# Altium project Control_Board.PrjPcb (part 1 of 2)
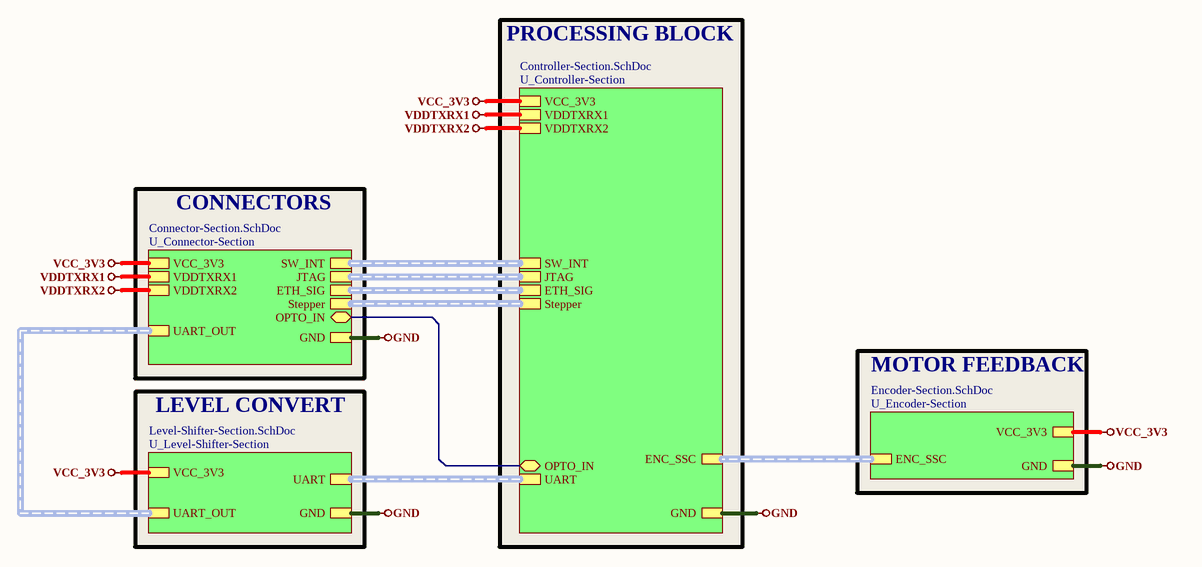
[diagram p0: Top-Sheet.SchDoc]
7 sheets, 87 parts. Net scope: hierarchical (ports join the sheet entries above them; power ports are global).
Board file: ControlBoard_PCB.PcbDoc
Sheets:
  Top-Sheet.SchDoc
    U_Connector-Section = Connector-Section.SchDoc
    U_Level-Shifter-Section = Level-Shifter-Section.SchDoc
    U_Controller-Section = Controller-Section.SchDoc
      U_Controller-Part-1 = Controller-Part-1.SchDoc
      U_Controller-Part-2 = Controller-Part-2.SchDoc
    U_Encoder-Section = Encoder-Section.SchDoc

## Sheet Top-Sheet.SchDoc
size A4; SheetNumber: 1

### Sub-sheets
U_Connector-Section = Connector-Section.SchDoc: SW_INT (harness SW_INT), JTAG (harness JTAG), ETH_SIG (harness ETH_SIG), VCC_3V3, GND, VDDTXRX1, VDDTXRX2, Stepper (harness Stepper), OPTO_IN (bidir), UART_OUT (harness UART_OUT)
U_Controller-Section = Controller-Section.SchDoc: JTAG (harness JTAG), SW_INT (harness SW_INT), ETH_SIG (harness ETH_SIG), Stepper (harness Stepper), VCC_3V3, ENC_SSC (harness ENC_SSC), UART (harness UART), GND, OPTO_IN (bidir), VDDTXRX1, VDDTXRX2
U_Encoder-Section = Encoder-Section.SchDoc: VCC_3V3, GND, ENC_SSC (harness ENC_SSC)
U_Level-Shifter-Section = Level-Shifter-Section.SchDoc: UART (harness UART), VCC_3V3, GND, UART_OUT (harness UART_OUT)

### Nets
GND: sheet U_Connector-Section/GND, sheet U_Level-Shifter-Section/GND, sheet U_Controller-Section/GND, sheet U_Encoder-Section/GND
VCC_3V3: sheet U_Connector-Section/VCC_3V3, sheet U_Level-Shifter-Section/VCC_3V3, sheet U_Controller-Section/VCC_3V3, sheet U_Encoder-Section/VCC_3V3
VDDTXRX1: sheet U_Connector-Section/VDDTXRX1, sheet U_Controller-Section/VDDTXRX1
VDDTXRX2: sheet U_Connector-Section/VDDTXRX2, sheet U_Controller-Section/VDDTXRX2
OPTO_IN: sheet U_Connector-Section/OPTO_IN, sheet U_Controller-Section/OPTO_IN

### Buses and harness runs
harness sheet U_Connector-Section/ETH_SIG = sheet U_Controller-Section/ETH_SIG
harness sheet U_Connector-Section/JTAG = sheet U_Controller-Section/JTAG
harness sheet U_Connector-Section/Stepper = sheet U_Controller-Section/Stepper
harness sheet U_Connector-Section/SW_INT = sheet U_Controller-Section/SW_INT
harness sheet U_Connector-Section/UART_OUT = sheet U_Level-Shifter-Section/UART_OUT
harness sheet U_Controller-Section/ENC_SSC = sheet U_Encoder-Section/ENC_SSC
harness sheet U_Controller-Section/UART = sheet U_Level-Shifter-Section/UART

### Notes on the sheet
- PROCESSING BLOCK
- CONNECTORS
- MOTOR FEEDBACK
- LEVEL CONVERT

## Sheet Connector-Section.SchDoc
size A4; SheetNumber: 7
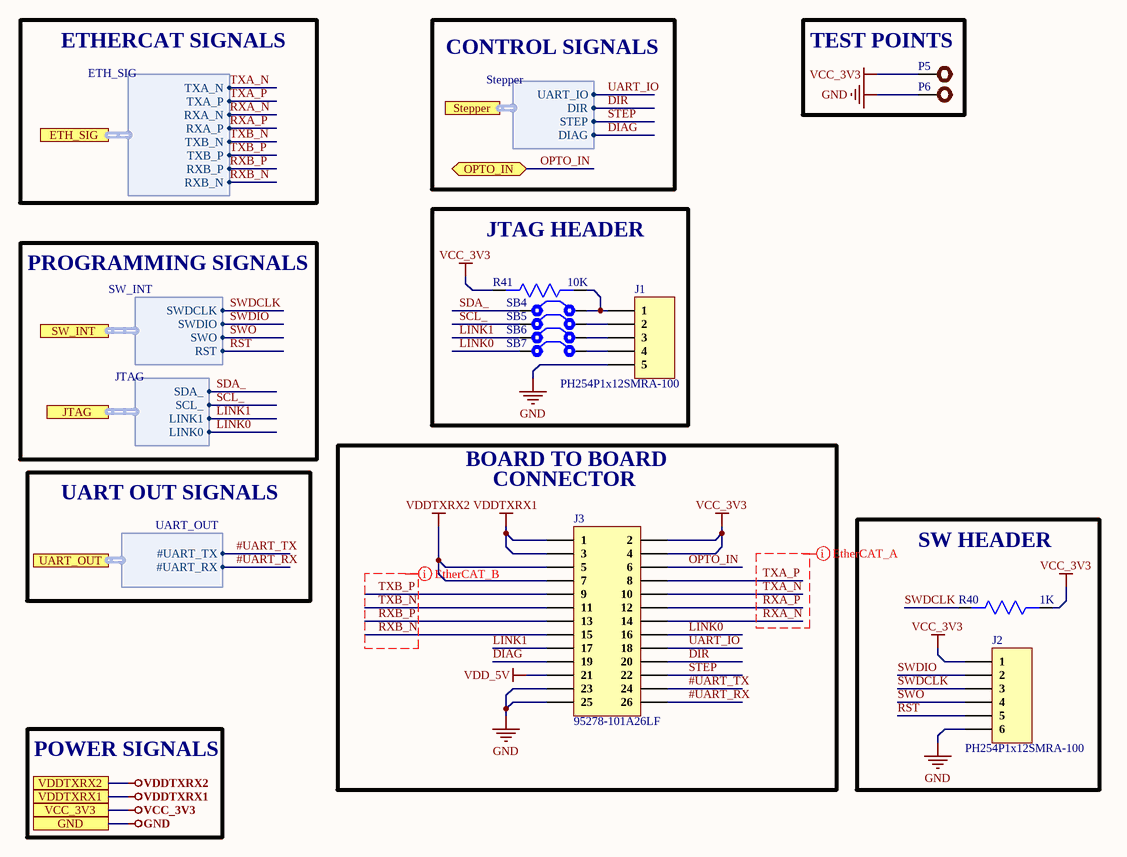
[diagram p1: Connector-Section.SchDoc]

### Parts
J1  PH254P1x12SMRA-100  [HDR1X5 SMD]
J2  PH254P1x12SMRA-100  [HDR1X6 SMD]
J3  95278-101A26LF  [95278-101A26LF]
P5  Test Point  [TEST POINT]  (value not drawn)
P6  Test Point  [TEST POINT]  (value not drawn)
R40  1K  [Res0603]
R41  10K  [Res0603]
SB4  Solder Bridge  [Solder Bridge]  (value not drawn)
SB5  Solder Bridge  [Solder Bridge]  (value not drawn)
SB6  Solder Bridge  [Solder Bridge]  (value not drawn)
SB7  Solder Bridge  [Solder Bridge]  (value not drawn)

### Blocks framed on the sheet
TEST POINTS: P5 P6
JTAG HEADER: J1 R41 SB4-SB7
SW HEADER: J2 R40

### Ports
ETH_SIG (harness ETH_SIG), GND, JTAG (harness JTAG), OPTO_IN (bidir), Stepper (harness Stepper), SW_INT (harness SW_INT), UART_OUT (harness UART_OUT), VCC_3V3, VDDTXRX1, VDDTXRX2

### Harnesses
SW_INT: SWDCLK, SWDIO, SWO, RST
JTAG: SDA_, SCL_, LINK1, LINK0
ETH_SIG: TXA_N, TXA_P, RXA_N, RXA_P, TXB_N, TXB_P, RXB_P, RXB_N
Stepper: UART_IO, DIR, STEP, DIAG
UART_OUT: #UART_TX, #UART_RX

### Nets
GND: J1.5 J2.6 J3.23 J3.25 P6.1 ; port GND
VCC_3V3: J2.1 J3.2 J3.4 P5.1 R40.1 R41.2 ; port VCC_3V3
VDD_5V: J3.21
VDDTXRX1: J3.1 J3.3 ; port VDDTXRX1
VDDTXRX2: J3.5 J3.7 ; port VDDTXRX2
#UART_RX: J3.26 ; port UART_OUT.#UART_RX
#UART_TX: J3.24 ; port UART_OUT.#UART_TX
DIAG: J3.19 ; port Stepper.DIAG
DIR: J3.20 ; port Stepper.DIR
LINK0: J3.16 SB7.1 ; port JTAG.LINK0
LINK1: J3.17 SB6.1 ; port JTAG.LINK1
OPTO_IN: J3.6 ; port OPTO_IN
RST: J2.5 ; port SW_INT.RST
RXA_N: J3.14 ; port ETH_SIG.RXA_N
RXA_P: J3.12 ; port ETH_SIG.RXA_P
RXB_N: J3.15 ; port ETH_SIG.RXB_N
RXB_P: J3.13 ; port ETH_SIG.RXB_P
SCL_: SB5.1 ; port JTAG.SCL_
SDA_: SB4.1 ; port JTAG.SDA_
STEP: J3.22 ; port Stepper.STEP
SWDCLK: J2.3 R40.2 ; port SW_INT.SWDCLK
SWDIO: J2.2 ; port SW_INT.SWDIO
SWO: J2.4 ; port SW_INT.SWO
TXA_N: J3.10 ; port ETH_SIG.TXA_N
TXA_P: J3.8 ; port ETH_SIG.TXA_P
TXB_N: J3.11 ; port ETH_SIG.TXB_N
TXB_P: J3.9 ; port ETH_SIG.TXB_P
UART_IO: J3.18 ; port Stepper.UART_IO
NetJ1_1: J1.1 R41.1 SB4.2
NetJ1_2: J1.2 SB5.2
NetJ1_3: J1.3 SB6.2
NetJ1_4: J1.4 SB7.2

### Layout directives
differential pair; differential pair class EtherCAT_A_Lines; net class EtherCAT_A; rule Matched Net Lengths [Tolerance = 1000mil]; rule Impedance Constraint [Min = 90.00    Max = 110.0    ]: RXA_N, RXA_P, TXA_N, TXA_P
differential pair; differential pair class EtherCAT_B_Lines; net class EtherCAT_B; rule Matched Net Lengths [Tolerance = 1000mil]; rule Impedance Constraint [Min = 90.00    Max = 110.0    ]: RXB_N, RXB_P, TXB_N, TXB_P

### Notes on the sheet
- ETHERCAT SIGNALS
- CONTROL SIGNALS
- PROGRAMMING SIGNALS
- BOARD TO BOARD
- UART OUT SIGNALS
- (near J3) CONNECTOR
- POWER SIGNALS

### Library data of the parts
J1 = PH254P1x12SMRA-100: 5 POS 2.54mm Pin Header Male single row Right Angle SMD; Manufacturer: RTLECS; Pin shape: Square pin; Pitch: 2.54
J2 = PH254P1x12SMRA-100_1: 6 POS 2.54mm Pin Header Male single row Right Angle SMD; Manufacturer: RTLECS; Pin shape: Square pin; Pitch: 2.54
J3 = 95278-101A26LF: CONN HEADER SMD 26POS 2.54MM; Manufacturer: Amphenol ICC (FCI); Manufacturer Part No:: 95278-101A26LF; Package: Custom; ComponentLink1Description: New link; ComponentLink1URL: https://www.digikey.com/en/products/detail/amphenol-icc-fci/95278-101A26LF/1488594
P5 P6 = TEST POINT: Test Point ON
R40 = RC0603FR-071KL: RES SMD 1K OHM 1% 1/10W 0603; Manufacturer: Yageo; Resistance: 1kR; Temperature Coefficient: 100ppm/°C; Power Rating: 100mW; Voltage Rating: 50V; ComponentLink1URL: https://www.verical.com/server-webapp/html/getDatasheet?partID=409289&src-supplier=Verical; ComponentLink1Description: https://www.verical.com/server-webapp/html/getDatasheet?partID=409289&src-supplier=Verical; Supplier 1: Digi-Key; Manufacturer Part Number: RC0603FR-071KL; Stock 1: 21472395; Pricing 1: 1=0.1, 10=0.023, 100=0.0094, 1000=0.0042, 2500=0.0037 (USD); Case/Package: 0603; Contact Plating: Tin,Matte; Case Code (Imperial): 0603; Case Code (Metric): 1608; Min Operating Temperature: -55°C; Max Operating Temperature: 155°C; Tolerance: 1%; Composition: Thick Film; Packaging: Tape and Reel; Termination: SMD/SMT; Military Standard: Not; Length: 1.6mm; Height: 0.45mm; Depth: 0.8mm; Radiation Hardening: No; REACH SVHC: No SVHC; Lead Free: Lead Free; ComponentLink2URL: http://documents.rs-components.com/techlib://itc_doclist_GB.htm?stockno=5048928&src-supplier=RSComponents; ComponentLink2Description: http://documents.rs-components.com/techlib://itc_doclist_GB.htm?stockno=5048928&src-supplier=RSComponents; ComponentLink3URL: http://www.yageo.com/documents/recent/PYu-RC0603_51_RoHS_L_4.pdf?src-supplier=Avnet+Europe; ComponentLink3Description: http://www.yageo.com/documents/recent/PYu-RC0603_51_RoHS_L_4.pdf?src-supplier=Avnet+Europe; ComponentLink4URL: http://www.farnell.com/datasheets/2167052.pdf?src-supplier=Element14; ComponentLink4Description: http://www.farnell.com/datasheets/2167052.pdf?src-supplier=Element14; ComponentLink5URL: http://www.farnell.com/datasheets/1868787.pdf?src-supplier=Element14; ComponentLink5Description: http://www.farnell.com/datasheets/1868787.pdf?src-supplier=Element14; ComponentLink6URL: http://www.yageo.com/documents/recent/PYu-RC_Group_51_RoHS_L_2.pdf?src-supplier=Avnet; ComponentLink6Description: http://www.yageo.com/documents/recent/PYu-RC_Group_51_RoHS_L_2.pdf?src-supplier=Avnet; ComponentLink7URL: https://www.verical.com/server-webapp/html/getDatasheet?partID=404327&src-supplier=Verical; ComponentLink7Description: https://www.verical.com/server-webapp/html/getDatasheet?partID=404327&src-supplier=Verical; ComponentLink8URL: http://www.farnell.com/datasheets/443971.pdf?src-supplier=Element14; ComponentLink8Description: http://www.farnell.com/datasheets/443971.pdf?src-supplier=Element14; Supplier Part Number 1: 311-1.00KHRDKR-ND
R41 = AC0603JR-0710KL: RES SMD 10K OHM 5% 1/10W 0603; Manufacturer: Yageo; Voltage Rating: 50V; Resistance: 10kR; Power Rating: 100mW; Temperature Coefficient: 100ppm/°C; Supplier 1: Future Electronics; Manufacturer Part Number: AC0603JR-0710KL; RoHS: Yes; Category: Chip SMD Resistors; Stock 1: 1533000; Pricing 1: 5000=0.00540 (USD); Case/Package: 0603; Case Code (Imperial): 0603; Case Code (Metric): 1608; Size Code: 0603; Min Operating Temperature: -55°C; Max Operating Temperature: 155°C; Packaging: Tape and Reel; Tolerance: 5%; Package Quantity: 1; Resistor Type: Thick Film; Termination: SMD/SMT; Number of Terminations: 2; Max Power Dissipation: 100mW; Features: Moisture Resistant,Automotive AEC-Q200,Anti-Sulfur; Series: AC; Construction: Rectangular; Length: 0.063inch; Width: 0.031inch; Height: 0.022inch; Depth: 0.8mm; Military Standard: Not; Lead Free: Lead Free; RoHS Compliant: Yes; ComponentLink1URL: https://datasheet.ciiva.com/5562/pyu-ac-51-rohs-l-2-5562553.pdf?src-supplier=Mouser; ComponentLink1Description: https://datasheet.ciiva.com/5562/pyu-ac-51-rohs-l-2-5562553.pdf?src-supplier=Mouser; Supplier Part Number 1: 1029044
SB4-SB7 = Solder Bridge: Solder Bridge ON

## Sheet Level-Shifter-Section.SchDoc
size A4; SheetNumber: 6
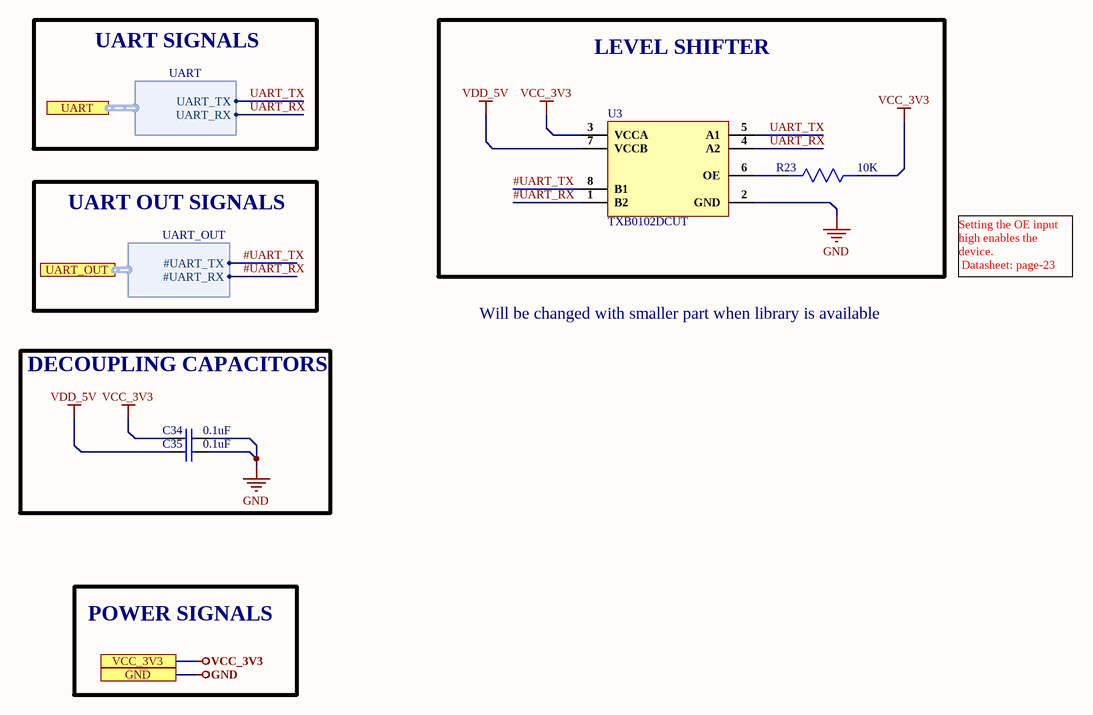
[diagram p2: Level-Shifter-Section.SchDoc]

### Parts
C34  0.1uF  [Cap0603]
C35  0.1uF  [Cap0603]
R23  10K  [Res0603]
U3  TXB0102DCUT  [TXB0102DCUT]

### Blocks framed on the sheet
LEVEL SHIFTER: R23 U3
DECOUPLING CAPACITORS: C34 C35

### Ports
GND, UART (harness UART), UART_OUT (harness UART_OUT), VCC_3V3

### Harnesses
UART: UART_TX, UART_RX
UART_OUT: #UART_TX, #UART_RX

### Nets
GND: C34.2 C35.2 U3.2(GND) ; port GND
VCC_3V3: C34.1 R23.1 U3.3(VCCA) ; port VCC_3V3
VDD_5V: C35.1 U3.7(VCCB)
#UART_RX: U3.1(B2) ; port UART_OUT.#UART_RX
#UART_TX: U3.8(B1) ; port UART_OUT.#UART_TX
UART_RX: U3.4(A2) ; port UART.UART_RX
UART_TX: U3.5(A1) ; port UART.UART_TX
NetR23_2: R23.2 U3.6(OE)

### Notes on the sheet
- UART SIGNALS
- UART OUT SIGNALS
- Will be changed with smaller part when library is available
- Setting the OE input high enables the device.
  Datasheet: page-23
- POWER SIGNALS

### Library data of the parts
C34 C35 = CC0603KRX7R0BB104: CAP CER 0.1UF 100V X7R 0603; Manufacturer: Yageo; Capacitance: 100nF; Tolerance: 10%; Supplier 1: Digi-Key; Manufacturer Part Number: CC0603KRX7R0BB104; RoHS: Yes; Category: Ceramic Capacitors; Stock 1: 60476; Pricing 1: 1=0.19000, 10=0.13500, 50=0.07680, 100=0.06370, 500=0.04466, 1000=0.03696 (USD); Mount: Surface Mount; Case/Package: 0603; Case Code (Metric): 1608; Case Code (Imperial): 0603; Weight: 7.1E-05oz; Min Operating Temperature: -55°C; Max Operating Temperature: 125°C; Package Quantity: 4000; Voltage Rating: 100V; Packaging: Tape and Reel; Dielectric: X7R; Termination: SMD/SMT; Resistor Type: Ceramic; Voltage Rating (DC): 100V; Series: CC; Length: 0.063inch; Width: 0.031inch; Thickness: 0.035inch; Depth: 0.8mm; Lead Free: Lead Free; RoHS Compliant: Yes; ComponentLink1URL: https://datasheet.ciiva.com/6277/mlccorderingcode-6277030.pdf?src-supplier=Digi-Key; ComponentLink1Description: https://datasheet.ciiva.com/6277/mlccorderingcode-6277030.pdf?src-supplier=Digi-Key; ComponentLink2URL: https://datasheet.ciiva.com/6277/mlccorderingcode-6277081.pdf?src-supplier=Digi-Key; ComponentLink2Description: https://datasheet.ciiva.com/6277/mlccorderingcode-6277081.pdf?src-supplier=Digi-Key; ComponentLink3URL: https://datasheet.ciiva.com/6277/mlccorderingcode-6277082.pdf?src-supplier=Digi-Key; ComponentLink3Description: https://datasheet.ciiva.com/6277/mlccorderingcode-6277082.pdf?src-supplier=Digi-Key; Supplier Part Number 1: 311-1523-1-ND
R23 = AC0603JR-0710KL: as R41 on sheet Connector-Section; Supplier 1: Future Electronics; Manufacturer Part Number: AC0603JR-0710KL; RoHS: Yes; Category: Chip SMD Resistors; Stock 1: 1533000; Pricing 1: 5000=0.00540 (USD); Case/Package: 0603; Case Code (Imperial): 0603; Case Code (Metric): 1608; Size Code: 0603; Min Operating Temperature: -55°C; Max Operating Temperature: 155°C; Packaging: Tape and Reel; Tolerance: 5%; Package Quantity: 1; Resistor Type: Thick Film; Termination: SMD/SMT; Number of Terminations: 2; Max Power Dissipation: 100mW; Features: Moisture Resistant,Automotive AEC-Q200,Anti-Sulfur; Series: AC; Construction: Rectangular; Length: 0.063inch; Width: 0.031inch; Height: 0.022inch; Depth: 0.8mm; Military Standard: Not; Lead Free: Lead Free; RoHS Compliant: Yes; ComponentLink1URL: https://datasheet.ciiva.com/5562/pyu-ac-51-rohs-l-2-5562553.pdf?src-supplier=Mouser; ComponentLink1Description: https://datasheet.ciiva.com/5562/pyu-ac-51-rohs-l-2-5562553.pdf?src-supplier=Mouser; Supplier Part Number 1: 1029044
U3 = TXB0102DCUT: IC TRNSLTR BIDIRECTIONAL US8; Manufacturer: Texas Instruments; Propagation Delay: 31ns; Min Supply Voltage: 1.65V; Max Supply Voltage: 5.5V; Data Rate: 100Mbps; Number of Channels: 2; Logic Function: Translator; Turn-On Delay Time: 7.4ns; High Level Output Current: -20uA; Low Level Output Current: 20uA; Output Type: 3-STATE; Output Current: 50mA; Supplier 1: Arrow Electronics; Manufacturer Part Number: TXB0102DCUT; RoHS: Yes; Category: Integrated Circuits (ICs); Stock 1: 10; Pricing 1: 1=0.79330, 10=0.66470, 25=0.65820, 250=0.37450, 500=0.36200, 1000=0.29770, 2500=0.28440 (USD); Mount: Surface Mount; Case/Package: VSSOP; Number of Pins: 8; Weight: 0.000339oz; Contact Plating: Gold; Min Operating Temperature: -40°C; Max Operating Temperature: 85°C; Packaging: Tape and Reel; Package Quantity: 1; Number of Bits: 2; Series: -; Number of Inputs: 2; Length: 2.3mm; Width: 2mm; Height: 0.85mm; Radiation Hardening: No; Lead Free: Lead Free; RoHS Compliant: Yes; REACH SVHC: No SVHC; ComponentLink1URL: https://datasheet.ciiva.com/4226/sces641b-4226901.pdf?src-supplier=Arrow+Electronics; ComponentLink1Description: https://datasheet.ciiva.com/4226/sces641b-4226901.pdf?src-supplier=Arrow+Electronics; ComponentLink2URL: https://datasheet.ciiva.com/15096/getdatasheetpartid-226009-15096242.pdf?src-supplier=Verical; ComponentLink2Description: https://datasheet.ciiva.com/15096/getdatasheetpartid-226009-15096242.pdf?src-supplier=Verical; ComponentLink3URL: https://datasheet.ciiva.com/14287/txb0102-14287498.pdf?src-supplier=Avnet; ComponentLink3Description: https://datasheet.ciiva.com/14287/txb0102-14287498.pdf?src-supplier=Avnet; ComponentLink4URL: https://datasheet.ciiva.com/14287/txb0102-14287370.pdf?src-supplier=Avnet; ComponentLink4Description: https://datasheet.ciiva.com/14287/txb0102-14287370.pdf?src-supplier=Avnet; ComponentLink5URL: https://datasheet.ciiva.com/6619/txb0102-6619255.pdf?src-supplier=Digi-Key; ComponentLink5Description: https://datasheet.ciiva.com/6619/txb0102-6619255.pdf?src-supplier=Digi-Key; ComponentLink6URL: https://datasheet.ciiva.com/6619/txb0102-6619256.pdf?src-supplier=Digi-Key; ComponentLink6Description: https://datasheet.ciiva.com/6619/txb0102-6619256.pdf?src-supplier=Digi-Key; ComponentLink7URL: https://datasheet.ciiva.com/6619/txb0102-6619257.pdf?src-supplier=Digi-Key; ComponentLink7Description: https://datasheet.ciiva.com/6619/txb0102-6619257.pdf?src-supplier=Digi-Key; Supplier Part Number 1: TXB0102DCUT

## Sheet Controller-Section.SchDoc
size A4; SheetNumber: 2
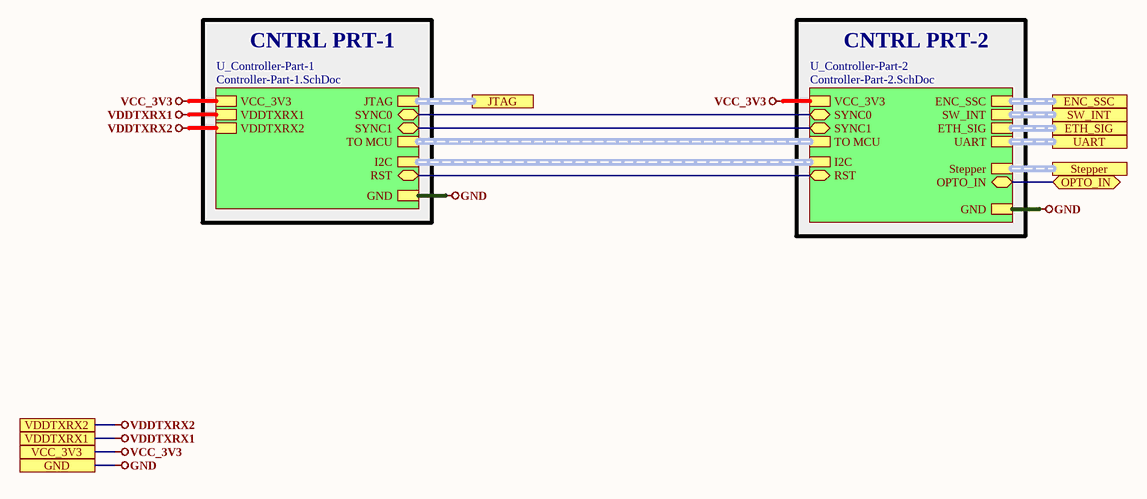
[diagram p3: Controller-Section.SchDoc]

### Sub-sheets
U_Controller-Part-1 = Controller-Part-1.SchDoc: JTAG (harness JTAG), VCC_3V3, GND, TO MCU (harness To MCU), RST (bidir), I2C (harness I2C), VDDTXRX1, VDDTXRX2, SYNC0 (bidir), SYNC1 (bidir)
U_Controller-Part-2 = Controller-Part-2.SchDoc: ENC_SSC (harness ENC_SSC), SW_INT (harness SW_INT), ETH_SIG (harness ETH_SIG), UART (harness UART), TO MCU (harness To MCU), Stepper (harness Stepper), OPTO_IN (bidir), VCC_3V3, GND, RST (bidir), I2C (harness I2C), SYNC0 (bidir), SYNC1 (bidir)

### Ports
ENC_SSC (harness ENC_SSC), ETH_SIG (harness ETH_SIG), GND, JTAG (harness JTAG), OPTO_IN (bidir), Stepper (harness Stepper), SW_INT (harness SW_INT), UART (harness UART), VCC_3V3, VDDTXRX1, VDDTXRX2

### Nets
GND: port GND, sheet U_Controller-Part-1/GND, sheet U_Controller-Part-2/GND
VCC_3V3: port VCC_3V3, sheet U_Controller-Part-1/VCC_3V3, sheet U_Controller-Part-2/VCC_3V3
VDDTXRX1: port VDDTXRX1, sheet U_Controller-Part-1/VDDTXRX1
VDDTXRX2: port VDDTXRX2, sheet U_Controller-Part-1/VDDTXRX2
OPTO_IN: port OPTO_IN, sheet U_Controller-Part-2/OPTO_IN
RST: sheet U_Controller-Part-1/RST, sheet U_Controller-Part-2/RST
NetU1_39: sheet U_Controller-Part-1/SYNC1, sheet U_Controller-Part-2/SYNC1
NetU1_63: sheet U_Controller-Part-1/SYNC0, sheet U_Controller-Part-2/SYNC0

### Buses and harness runs
harness port ENC_SSC = sheet U_Controller-Part-2/ENC_SSC
harness port ETH_SIG = sheet U_Controller-Part-2/ETH_SIG
harness port JTAG = sheet U_Controller-Part-1/JTAG
harness port Stepper = sheet U_Controller-Part-2/Stepper
harness port SW_INT = sheet U_Controller-Part-2/SW_INT
harness port UART = sheet U_Controller-Part-2/UART
harness sheet U_Controller-Part-1/I2C = sheet U_Controller-Part-2/I2C
harness sheet U_Controller-Part-1/TO MCU = sheet U_Controller-Part-2/TO MCU

### Notes on the sheet
- CNTRL PRT-1
- CNTRL PRT-2

## Sheet Controller-Part-1.SchDoc
size A4; SheetNumber: 3
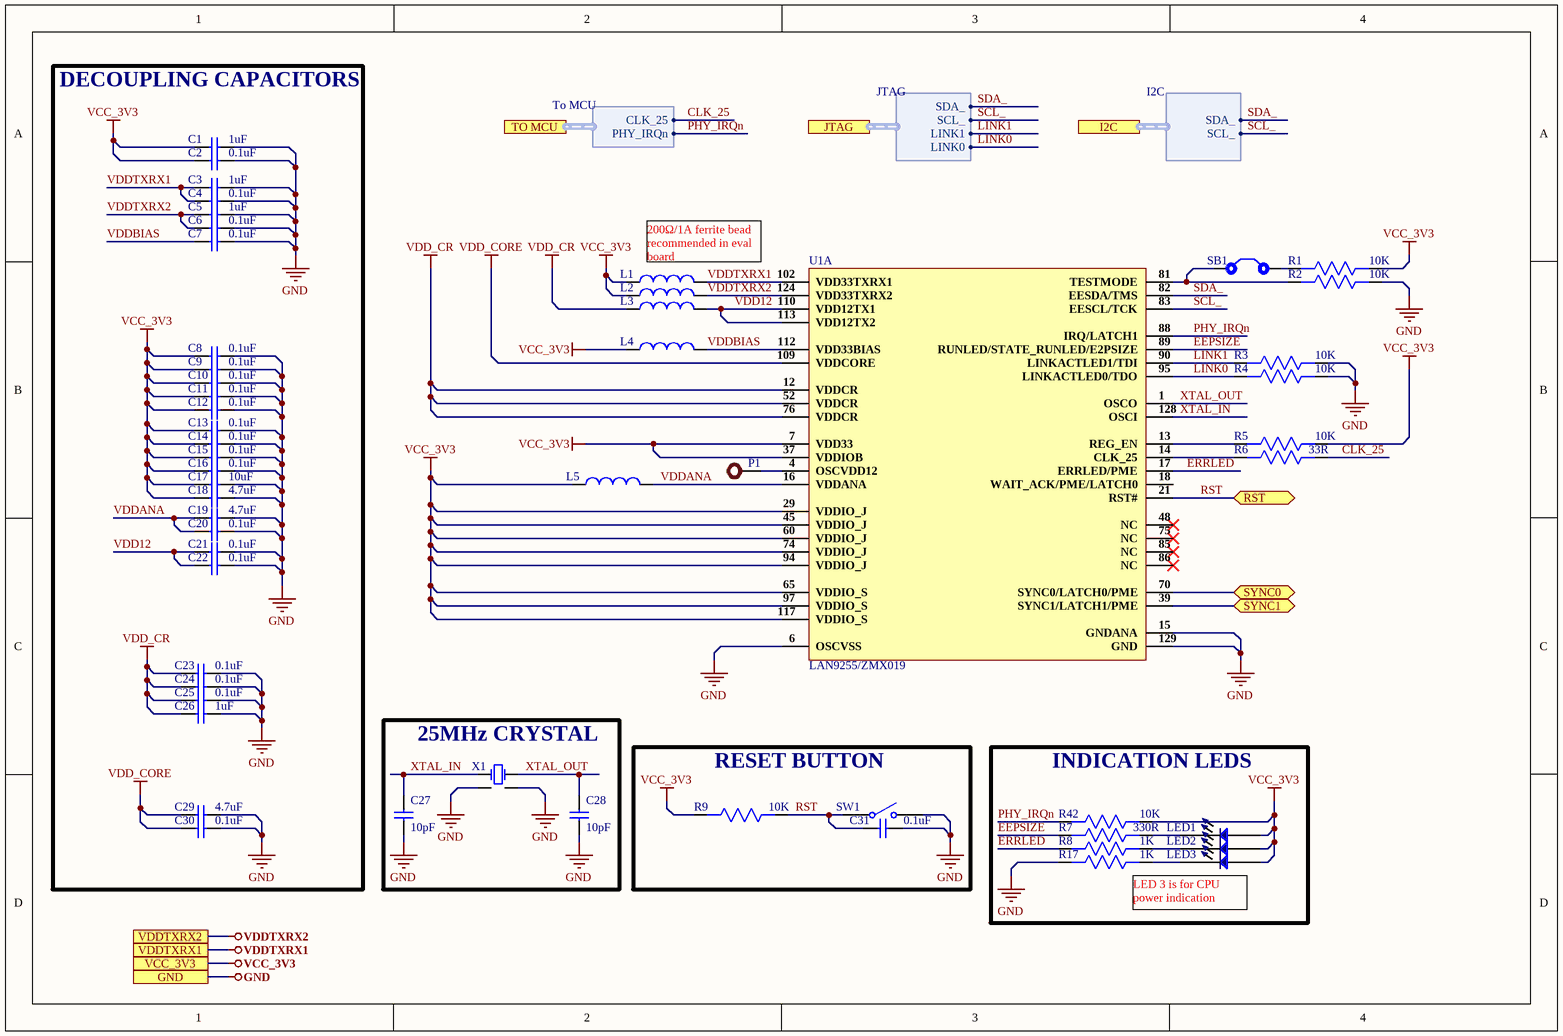
[diagram p4: Controller-Part-1.SchDoc]

### Parts
C1  1uF  [Cap0805]
C2  0.1uF  [Cap0603]
C3  1uF  [Cap0805]
C4  0.1uF  [Cap0603]
C5  1uF  [Cap0805]
C6  0.1uF  [Cap0603]
C7  0.1uF  [Cap0603]
C8  0.1uF  [Cap0603]
C9  0.1uF  [Cap0603]
C10  0.1uF  [Cap0603]
C11  0.1uF  [Cap0603]
C12  0.1uF  [Cap0603]
C13  0.1uF  [Cap0603]
C14  0.1uF  [Cap0603]
C15  0.1uF  [Cap0603]
C16  0.1uF  [Cap0603]
C17  10uF  [Cap0805]
C18  4.7uF  [Cap0603]
C19  4.7uF  [Cap0603]
C20  0.1uF  [Cap0603]
C21  0.1uF  [Cap0603]
C22  0.1uF  [Cap0603]
C23  0.1uF  [Cap0603]
C24  0.1uF  [Cap0603]
C25  0.1uF  [Cap0603]
C26  1uF  [Cap0805]
C27  10pF  [Cap0603]
C28  10pF  [Cap0603]
C29  4.7uF  [Cap0603]
C30  0.1uF  [Cap0603]
C31  0.1uF  [Cap0603]
L1  MLB1608-201P1A(f)  [MLB1608-201P1A(f)]  (value not drawn)
L2  MLB1608-201P1A(f)  [MLB1608-201P1A(f)]  (value not drawn)
L3  MLB1608-201P1A(f)  [MLB1608-201P1A(f)]  (value not drawn)
L4  MLB1608-201P1A(f)  [MLB1608-201P1A(f)]  (value not drawn)
L5  MLB1608-201P1A(f)  [MLB1608-201P1A(f)]  (value not drawn)
LED1  16-213/GHC-YR1S1/3T  [LED 0402]  (value not drawn)
LED2  16-213/GHC-YR1S1/3T  [LED 0402]  (value not drawn)
LED3  16-213/GHC-YR1S1/3T  [LED 0402]  (value not drawn)
P1  Test Point  [TEST POINT]  (value not drawn)
R1  10K  [Res0603]
R2  10K  [Res0603]
R3  10K  [Res0603]
R4  10K  [Res0603]
R5  10K  [Res0603]
R6  33R  [Res0603]
R7  330R  [Res0603]
R8  1K  [Res0603]
R9  10K  [Res0603]
R17  1K  [Res0603]
R42  10K  [Res0603]
SB1  Solder Bridge  [Solder Bridge]  (value not drawn)
SW1  B3U-1000P  [B3U-1000P]  (value not drawn)
U1  LAN9255/ZMX019  [LAN9255/ZMX019]  (part A of 3)
X1  C3E-25.000-8-1015-X-M  [C3E-25.000-8-1015-X-M]  (value not drawn)

### Blocks framed on the sheet
DECOUPLING CAPACITORS: C1-C26 C29 C30
25MHz CRYSTAL: C27 C28 X1
RESET BUTTON: C31 R9 SW1
INDICATION LEDS: LED1-LED3 R7 R8 R17 R42

### Ports
GND, I2C (harness I2C), JTAG (harness JTAG), RST (bidir), SYNC0 (bidir), SYNC1 (bidir), TO MCU (harness To MCU), VCC_3V3, VDDTXRX1, VDDTXRX2

### Harnesses
JTAG: SDA_, SCL_, LINK1, LINK0
To MCU: CLK_25, PHY_IRQn
I2C: SDA_, SCL_

### Nets
GND: C1.2 C2.2 C3.2 C4.2 C5.2 C6.2 C7.2 C8.2 C9.2 C10.2 C11.2 C12.2 C13.2 C14.2 C15.2 C16.2 C17.2 C18.2 C19.2 C20.2 C21.2 C22.2 C23.2 C24.2 C25.2 C26.2 C27.1 C28.1 C29.2 C30.2 C31.2 R2.1 R3.1 R4.1 R17.2 SW1.2 U1.6(OSCVSS) U1.15(GNDANA) U1.129(GND) X1.2(GND) X1.4(GND) ; port GND
VCC_3V3: C1.1 C2.1 C8.1 C9.1 C10.1 C11.1 C12.1 C13.1 C14.1 C15.1 C16.1 C17.1 C18.1 L1.1 L2.1 L4.1 L5.1 LED1.1 LED2.1 LED3.1 R1.1 R5.1 R9.2 R42.1 U1.7(VDD33) U1.29(VDDIO_J) U1.37(VDDIOB) U1.45(VDDIO_J) U1.60(VDDIO_J) U1.65(VDDIO_S) U1.74(VDDIO_J) U1.94(VDDIO_J) U1.97(VDDIO_S) U1.117(VDDIO_S) ; port VCC_3V3
VDD_CORE: C29.1 C30.1 U1.109(VDDCORE)
VDD_CR: C23.1 C24.1 C25.1 C26.1 L3.1 U1.12(VDDCR) U1.52(VDDCR) U1.76(VDDCR)
VDDTXRX1: C3.1 C4.1 L1.2 U1.102(VDD33TXRX1) ; port VDDTXRX1
VDDTXRX2: C5.1 C6.1 L2.2 U1.124(VDD33TXRX2) ; port VDDTXRX2
CLK_25: R6.1 ; port TO MCU.CLK_25
EEPSIZE: R7.2 U1.89(RUNLED/STATE_RUNLED/E2PSIZE)
ERRLED: R8.2 U1.17(ERRLED/PME)
LINK0: R4.2 U1.95(LINKACTLED0/TDO) ; port JTAG.LINK0
LINK1: R3.2 U1.90(LINKACTLED1/TDI) ; port JTAG.LINK1
PHY_IRQn: R42.2 U1.88(IRQ/LATCH1) ; port TO MCU.PHY_IRQn
RST: C31.1 R9.1 SW1.1 U1.21(RST#) ; port RST
SCL_: U1.83(EESCL/TCK) ; port JTAG.SCL_, port I2C.SCL_
SDA_: U1.82(EESDA/TMS) ; port JTAG.SDA_, port I2C.SDA_
VDD12: C21.1 C22.1 L3.2 U1.110(VDD12TX1) U1.113(VDD12TX2)
VDDANA: C19.1 C20.1 L5.2 U1.16(VDDANA)
VDDBIAS: C7.1 L4.2 U1.112(VDD33BIAS)
XTAL_IN: C27.2 U1.128(OSCI) X1.1(OSC1)
XTAL_OUT: C28.2 U1.1(OSCO) X1.3(OSC2)
NetLED1_2: LED1.2 R7.1
NetLED2_2: LED2.2 R8.1
NetLED3_2: LED3.2 R17.1
NetP1_1: P1.1 U1.4(OSCVDD12)
NetR1_2: R1.2 SB1.2
NetR2_2: R2.2 SB1.1 U1.81(TESTMODE)
NetR5_2: R5.2 U1.13(REG_EN)
NetR6_2: R6.2 U1.14(CLK_25)
NetU1_39: U1.39(SYNC1/LATCH1/PME) ; port SYNC1
NetU1_63: U1.70(SYNC0/LATCH0/PME) ; port SYNC0

Not connected (* = marked no-connect by the designer): U1 18(WAIT_ACK/PME/LATCH0) 48(NC)* 75(NC)* 85(NC)* 86(NC)*

### Notes on the sheet
- 200Ω/1A ferrite bead recommended in eval board
- LED 3 is for CPU power indication

### Library data of the parts
C1 C3 C5 C26 = GCM21BC72A105KE36L: CAP CER 1UF 100V X7S 0805; Manufacturer: Murata; Tolerance: 10%; Supplier 1: Digi-Key; Manufacturer Part Number: GCM21BC72A105KE36L; RoHS: Yes; Category: Ceramic Capacitors; Stock 1: 179138; Pricing 1: 1=0.48000, 10=0.34100, 50=0.25800, 100=0.22480, 500=0.16650, 1000=0.14152 (USD); Mount: Surface Mount; Case/Package: 0805; Case Code (Imperial): 0805; Case Code (Metric): 2012; Min Operating Temperature: -55°C; Max Operating Temperature: 125°C; Packaging: Cut Tape; Capacitance: 1uF; Voltage Rating: 100V; Ratings: AEC-Q200; RoHS Compliant: Yes; ComponentLink1URL: http://search.murata.co.jp/Ceramy/image/img/A01X/partnumbering_e_02.pdf?src-supplier=Digi-Key; ComponentLink1Description: http://search.murata.co.jp/Ceramy/image/img/A01X/partnumbering_e_02.pdf?src-supplier=Digi-Key; Supplier Part Number 1: 490-14436-1-ND
C2 C4 C6-C16 C20-C25 C30 C31 = CC0603KRX7R0BB104: as C34 on sheet Level-Shifter-Section; Supplier 1: Digi-Key; Manufacturer Part Number: CC0603KRX7R0BB104; RoHS: Yes; Category: Ceramic Capacitors; Stock 1: 60476; Pricing 1: 1=0.19000, 10=0.13500, 50=0.07680, 100=0.06370, 500=0.04466, 1000=0.03696 (USD); Mount: Surface Mount; Case/Package: 0603; Case Code (Metric): 1608; Case Code (Imperial): 0603; Weight: 7.1E-05oz; Min Operating Temperature: -55°C; Max Operating Temperature: 125°C; Package Quantity: 4000; Voltage Rating: 100V; Packaging: Tape and Reel; Dielectric: X7R; Termination: SMD/SMT; Resistor Type: Ceramic; Voltage Rating (DC): 100V; Series: CC; Length: 0.063inch; Width: 0.031inch; Thickness: 0.035inch; Depth: 0.8mm; Lead Free: Lead Free; RoHS Compliant: Yes; ComponentLink1URL: https://datasheet.ciiva.com/6277/mlccorderingcode-6277030.pdf?src-supplier=Digi-Key; ComponentLink1Description: https://datasheet.ciiva.com/6277/mlccorderingcode-6277030.pdf?src-supplier=Digi-Key; ComponentLink2URL: https://datasheet.ciiva.com/6277/mlccorderingcode-6277081.pdf?src-supplier=Digi-Key; ComponentLink2Description: https://datasheet.ciiva.com/6277/mlccorderingcode-6277081.pdf?src-supplier=Digi-Key; ComponentLink3URL: https://datasheet.ciiva.com/6277/mlccorderingcode-6277082.pdf?src-supplier=Digi-Key; ComponentLink3Description: https://datasheet.ciiva.com/6277/mlccorderingcode-6277082.pdf?src-supplier=Digi-Key; Supplier Part Number 1: 311-1523-1-ND
C17 = GRM21BR61H106ME43L: CAP CER 10UF 50V X5R 0805; Manufacturer: Murata; Supplier 1: Digi-Key; Manufacturer Part Number: GRM21BR61H106ME43L; RoHS: Yes; Category: Ceramic Capacitors; Stock 1: 26; Pricing 1: 1=0.44000, 10=0.30700, 50=0.21500, 100=0.18420, 500=0.13818, 1000=0.11668 (USD); Supplier Part Number 1: 490-18664-1-ND
C18 C19 C29 = C1608X5R1E475M080AC: CAP CER 4.7UF 25V X5R 0603; Manufacturer: TDK; Dielectric Material: Ceramic; Tolerance: 20%; ComponentLink1URL: http://www.yageo.com/NewPortal/_en/search/productDocs.jsp?YageoPartNumber=AC0603JRNPO0BN470&src-supplier=Digi-Key; ComponentLink1Description: http://www.yageo.com/NewPortal/_en/search/productDocs.jsp?YageoPartNumber=AC0603JRNPO0BN470&src-supplier=Digi-Key; Supplier 1: Mouser; Manufacturer Part Number: C1608X5R1E475M080AC; Stock 1: 40236; Pricing 1: 1=0.29, 10=0.237, 100=0.142, 500=0.106, 1000=0.09, 4000=0.076, 8000=0.072, 24000=0.07, 48000=0.067 (USD); Mount: Surface Mount; Case/Package: 0603; Weight: 7.1E-05oz; Case Code (Metric): 1608; Case Code (Imperial): 0603; Min Operating Temperature: -55°C; Max Operating Temperature: 85°C; Voltage Rating (DC): 25V; Packaging: Tape and Reel; Package Quantity: 1; Capacitance: 4.7uF; Voltage Rating: 25V; Dielectric: X5R; Termination: SMD/SMT; Composition: Ceramic; Length: 1.6mm; Height: 0.8mm; Width: 0.031inch; Thickness: 0.039inch; Depth: 0.8mm; Radiation Hardening: No; REACH SVHC: No SVHC; Lead Free: Lead Free; ComponentLink2URL: https://www.verical.com/server-webapp/html/getDatasheet?partID=726745&src-supplier=Verical; ComponentLink2Description: https://www.verical.com/server-webapp/html/getDatasheet?partID=726745&src-supplier=Verical; Supplier Part Number 1: 810-C1608X5R1E475M
C27 C28 = 06035A100JAT2A: CAP CER 10PF 50V C0G/NP0 0603; Manufacturer: Kyocera AVX; Manufacturer Part Number: 06035A100JAT2A/4K; Tolerance: 5%; Dielectric: C0G; Temperature Coefficient: 30ppm/°C; Insulation Resistance: 100GR; Supplier 1: Digi-Key; Stock 1: 196463; Pricing 1: 1=0.1, 10=0.05, 50=0.0272, 100=0.0222, 500=0.01586, 1000=0.01246 (USD); Mount: Surface Mount; Case/Package: 0603; Number of Pins: 2; Min Operating Temperature: -55°C; Max Operating Temperature: 125°C; Capacitance: 10pF; Packaging: Cut Tape; Voltage Rating (DC): 50V; Voltage: 50V; Length: 1.6mm; Width: 810um; Height: 0.9mm; Depth: 0.81mm; Thickness: 864um; REACH SVHC: No SVHC; Lead Free: Lead Free; Supplier Part Number 1: 478-1163-1-ND
L1-L5 = MLB1608-201P1A(f): 200Ω @ 100MHz 1 1A 300mΩ 0603 Ferrite Beads; Manufacturer: Meled; Number of Lines: 1; Impedance @ Frequency: 200Ω @ 100MHz; Current Rating (Max): 1A; DC Resistance (DCR) (Max): 300mΩ
LED1-LED3 = 16-213/GHC-YR1S1/3T: Green 520~535nm 0402 Light Emitting Diodes (LED) RoHS; Manufacturer: Everlight Elec; Luminous Intensity (IF=20mA): 112~285mcd; Package: 0402; Illumination Color: Green; Dominant Wavelength / Coordinate rank: 520~535nm; Mounting Type: Surface Mount
P1 = TEST POINT: Test Point ON
R1-R5 R9 R42 = AC0603JR-0710KL: as R41 on sheet Connector-Section; Supplier 1: Future Electronics; Manufacturer Part Number: AC0603JR-0710KL; RoHS: Yes; Category: Chip SMD Resistors; Stock 1: 1533000; Pricing 1: 5000=0.00540 (USD); Case/Package: 0603; Case Code (Imperial): 0603; Case Code (Metric): 1608; Size Code: 0603; Min Operating Temperature: -55°C; Max Operating Temperature: 155°C; Packaging: Tape and Reel; Tolerance: 5%; Package Quantity: 1; Resistor Type: Thick Film; Termination: SMD/SMT; Number of Terminations: 2; Max Power Dissipation: 100mW; Features: Moisture Resistant,Automotive AEC-Q200,Anti-Sulfur; Series: AC; Construction: Rectangular; Length: 0.063inch; Width: 0.031inch; Height: 0.022inch; Depth: 0.8mm; Military Standard: Not; Lead Free: Lead Free; RoHS Compliant: Yes; ComponentLink1URL: https://datasheet.ciiva.com/5562/pyu-ac-51-rohs-l-2-5562553.pdf?src-supplier=Mouser; ComponentLink1Description: https://datasheet.ciiva.com/5562/pyu-ac-51-rohs-l-2-5562553.pdf?src-supplier=Mouser; Supplier Part Number 1: 1029044
R6 = RC0603FR-0733RL: RES SMD 0603 33 Ohm 1% 1/10W; Manufacturer: Yageo; Temperature Coefficient: 100ppm/°C; Voltage Rating (DC): 50V; Power Rating: 100mW; Voltage Rating: 75V; Supplier 1: Digi-Key; Manufacturer Part Number: RC0603FR-0733RL; RoHS: Yes; Category: Chip SMD Resistors; Stock 1: 41; Pricing 1: 1=0.10000, 10=0.02400, 100=0.00970, 1000=0.00436, 2500=0.00378 (USD); Case/Package: 0603; Number of Pins: 2; Case Code (Metric): 1608; Case Code (Imperial): 0603; Weight: 7.1E-05oz; Size Code: 0603; Min Operating Temperature: -55°C; Max Operating Temperature: 155°C; Resistance: 33R; Tolerance: 1%; Resistor Type: Thick Film; Packaging: Tape and Reel; Package Quantity: 1; Number of Terminations: 2; Termination: SMD/SMT; Max Power Dissipation: 100mW; Features: Moisture Resistant; Series: RC; Resistance Tolerance: 1%; Technology: THICK FILM; Construction: Rectangular; Length: 1.6mm; Width: 0.8mm; Height: 0.45mm; Depth: 0.8mm; Lead Pitch: 0.3mm; REACH SVHC: No SVHC; Lead Free: Lead Free; Military Standard: Not; RoHS Compliant: Yes; ComponentLink1URL: https://datasheet.ciiva.com/11808/0900766b80f96399-11808741.pdf?src-supplier=RSComponents; ComponentLink1Description: https://datasheet.ciiva.com/11808/0900766b80f96399-11808741.pdf?src-supplier=RSComponents; ComponentLink2URL: https://datasheet.ciiva.com/2453/pyu-r-int-thick-7-2453952.pdf?src-supplier=Digi-Key; ComponentLink2Description: https://datasheet.ciiva.com/2453/pyu-r-int-thick-7-2453952.pdf?src-supplier=Digi-Key; ComponentLink3URL: https://datasheet.ciiva.com/2453/pyu-r-int-thick-7-2453953.pdf?src-supplier=Digi-Key; ComponentLink3Description: https://datasheet.ciiva.com/2453/pyu-r-int-thick-7-2453953.pdf?src-supplier=Digi-Key; ComponentLink4URL: https://datasheet.ciiva.com/2453/pyu-r-int-thick-7-2453954.pdf?src-supplier=Digi-Key; ComponentLink4Description: https://datasheet.ciiva.com/2453/pyu-r-int-thick-7-2453954.pdf?src-supplier=Digi-Key; ComponentLink5URL: https://datasheet.ciiva.com/7660/38590-7660792.pdf?src-supplier=Element14; ComponentLink5Description: https://datasheet.ciiva.com/7660/38590-7660792.pdf?src-supplier=Element14; ComponentLink6URL: https://datasheet.ciiva.com/15189/getdatasheetpartid-326673-15189708.pdf?src-supplier=Verical; ComponentLink6Description: https://datasheet.ciiva.com/15189/getdatasheetpartid-326673-15189708.pdf?src-supplier=Verical; ComponentLink7URL: https://datasheet.ciiva.com/7746/443971-7746334.pdf?src-supplier=Element14; ComponentLink7Description: https://datasheet.ciiva.com/7746/443971-7746334.pdf?src-supplier=Element14; ComponentLink8URL: https://datasheet.ciiva.com/7746/443971-7746335.pdf?src-supplier=Element14; ComponentLink8Description: https://datasheet.ciiva.com/7746/443971-7746335.pdf?src-supplier=Element14; ComponentLink9URL: https://datasheet.ciiva.com/46395/443971-46395007.pdf?src-supplier=Element14; ComponentLink9Description: https://datasheet.ciiva.com/46395/443971-46395007.pdf?src-supplier=Element14; Supplier Part Number 1: 311-33.0HRCT-ND
R7 = RC0603JR-07330RL: RES  SMD 330R 100 mW 0603; Manufacturer: Yageo; Power Rating: 100mW; Tolerance: 5%; Voltage Rating (DC): 50V; Temperature Coefficient: 100ppm/°C; Supplier 1: Digi-Key; Manufacturer Part Number: RC0603JR-07330RL; RoHS: Yes; Category: Chip SMD Resistors; Stock 1: 1074593; Pricing 1: 1=0.10000, 10=0.02000, 100=0.00800, 1000=0.00360, 2500=0.00312 (USD); Case/Package: 0603; Number of Pins: 2; Case Code (Imperial): 0603; Case Code (Metric): 1608; Size Code: 0603; Min Operating Temperature: -55°C; Max Operating Temperature: 155°C; Resistance: 330R; Packaging: Tape and Reel; Voltage Rating: 50V; Package Quantity: 5000; Termination: SMD/SMT; Resistor Type: Thick Film; Features: Moisture Resistant; Series: RC; Max Power Dissipation: 100mW; Number of Terminations: 2; Resistance Tolerance: 5%; Construction: Rectangular; Length: 1.6mm; Width: 0.8mm; Height: 0.45mm; Depth: 0.8mm; REACH SVHC: No SVHC; Lead Free: Lead Free; Military Standard: Not; RoHS Compliant: Yes; Supplier Part Number 1: 311-330GRCT-ND
R8 R17 = RC0603FR-071KL: as R40 on sheet Connector-Section; ComponentLink1URL: https://www.verical.com/server-webapp/html/getDatasheet?partID=409289&src-supplier=Verical; ComponentLink1Description: https://www.verical.com/server-webapp/html/getDatasheet?partID=409289&src-supplier=Verical; Supplier 1: Digi-Key; Manufacturer Part Number: RC0603FR-071KL; Stock 1: 21472395; Pricing 1: 1=0.1, 10=0.023, 100=0.0094, 1000=0.0042, 2500=0.0037 (USD); Case/Package: 0603; Contact Plating: Tin,Matte; Case Code (Imperial): 0603; Case Code (Metric): 1608; Min Operating Temperature: -55°C; Max Operating Temperature: 155°C; Tolerance: 1%; Composition: Thick Film; Packaging: Tape and Reel; Termination: SMD/SMT; Military Standard: Not; Length: 1.6mm; Height: 0.45mm; Depth: 0.8mm; Radiation Hardening: No; REACH SVHC: No SVHC; Lead Free: Lead Free; ComponentLink2URL: http://documents.rs-components.com/techlib://itc_doclist_GB.htm?stockno=5048928&src-supplier=RSComponents; ComponentLink2Description: http://documents.rs-components.com/techlib://itc_doclist_GB.htm?stockno=5048928&src-supplier=RSComponents; ComponentLink3URL: http://www.yageo.com/documents/recent/PYu-RC0603_51_RoHS_L_4.pdf?src-supplier=Avnet+Europe; ComponentLink3Description: http://www.yageo.com/documents/recent/PYu-RC0603_51_RoHS_L_4.pdf?src-supplier=Avnet+Europe; ComponentLink4URL: http://www.farnell.com/datasheets/2167052.pdf?src-supplier=Element14; ComponentLink4Description: http://www.farnell.com/datasheets/2167052.pdf?src-supplier=Element14; ComponentLink5URL: http://www.farnell.com/datasheets/1868787.pdf?src-supplier=Element14; ComponentLink5Description: http://www.farnell.com/datasheets/1868787.pdf?src-supplier=Element14; ComponentLink6URL: http://www.yageo.com/documents/recent/PYu-RC_Group_51_RoHS_L_2.pdf?src-supplier=Avnet; ComponentLink6Description: http://www.yageo.com/documents/recent/PYu-RC_Group_51_RoHS_L_2.pdf?src-supplier=Avnet; ComponentLink7URL: https://www.verical.com/server-webapp/html/getDatasheet?partID=404327&src-supplier=Verical; ComponentLink7Description: https://www.verical.com/server-webapp/html/getDatasheet?partID=404327&src-supplier=Verical; ComponentLink8URL: http://www.farnell.com/datasheets/443971.pdf?src-supplier=Element14; ComponentLink8Description: http://www.farnell.com/datasheets/443971.pdf?src-supplier=Element14; Supplier Part Number 1: 311-1.00KHRDKR-ND
SB1 = Solder Bridge: Solder Bridge ON
SW1 = B3U-1000P: SWITCH TACTILE SPST-NO 0.05A 12V; Manufacturer: Omron; Mechanical Life: 200000Cycles; Operating Force: 1.5N; Throw Configuration: SPST; Current Rating: 50mA; Contact Resistance: 100mR; Illumination Type: Non-Illuminated,Illuminated; Switch Travel: 0.15mm; Switch Function: Off-Mom; Actuator Type: Standard; Actuator Length: 0.4mm; Ratings: Dust Proof,IP40; ComponentLink1URL: http://www.farnell.com/datasheets/60838.pdf?src-supplier=Farnell; ComponentLink1Description: http://www.farnell.com/datasheets/60838.pdf?src-supplier=Farnell; ComponentLink2URL: http://www.farnell.com/datasheets/60838.pdf?src-supplier=Element14; ComponentLink2Description: http://www.farnell.com/datasheets/60838.pdf?src-supplier=Element14; ComponentLink3URL: https://omronfs.omron.com/en_US/ecb/products/pdf/en-b3u.pdf?src-supplier=Digi-Key; ComponentLink3Description: https://omronfs.omron.com/en_US/ecb/products/pdf/en-b3u.pdf?src-supplier=Digi-Key; ComponentLink4URL: http://www.omron.com/ecb/products/pdf/en-b3u.pdf?src-supplier=Digi-Key; ComponentLink4Description: http://www.omron.com/ecb/products/pdf/en-b3u.pdf?src-supplier=Digi-Key; ComponentLink5URL: https://www.distrelec.biz/Web/Downloads/he/et/B3U_eng_datasheet.pdf?mime=application%2Fpdf&src-supplier=Distrelec; ComponentLink5Description: https://www.distrelec.biz/Web/Downloads/he/et/B3U_eng_datasheet.pdf?mime=application%2Fpdf&src-supplier=Distrelec; ComponentLink6URL: http://www.onlinecomponents.com/productFiles/mf-OM/en-b3u.pdf?src-supplier=Onlinecomponents.com; ComponentLink6Description: http://www.onlinecomponents.com/productFiles/mf-OM/en-b3u.pdf?src-supplier=Onlinecomponents.com; Supplier 1: Digi-Key; Manufacturer Part Number: B3U-1000P; Stock 1: 116454; Pricing 1: 1=1, 10=0.961, 25=0.9064, 50=0.7976, 100=0.7251, 250=0.68888, 500=0.67074, 1000=0.52571 (USD); Mount: Surface Mount; Weight: 0.000776oz; Contact Material: Silver; Min Operating Temperature: -25°C; Max Operating Temperature: 70°C; Packaging: Tape and Reel; Voltage Rating (DC): 12V; Package Quantity: 1; Max Current Rating: 50mA; Termination: SMD/SMT; Orientation: Straight; Max Voltage Rating (DC): 12V; Electrical Life: 200000Cycles; Insulation Resistance: 100MR; Contact Current Rating: 50mA; Length: 4mm; Height: 1.2mm; Depth: 2.5mm; Width: 3mm; REACH SVHC: Unknown; Lead Free: Lead Free; ComponentLink7URL: https://www.verical.com/server-webapp/html/getDatasheet?partID=552554&src-supplier=Verical; ComponentLink7Description: https://www.verical.com/server-webapp/html/getDatasheet?partID=552554&src-supplier=Verical; ComponentLink8URL: http://www.farnell.com/datasheets/1685550.pdf?src-supplier=Element14; ComponentLink8Description: http://www.farnell.com/datasheets/1685550.pdf?src-supplier=Element14; ComponentLink9URL: http://www.farnell.com/datasheets/2610940.pdf?src-supplier=Farnell; ComponentLink9Description: http://www.farnell.com/datasheets/2610940.pdf?src-supplier=Farnell; ComponentLink10URL: https://www.alliedelec.com/m/d/4c8a9ef82804fc3c241a13c1e298fd73.pdf?src-supplier=Allied+Electronics; ComponentLink10Description: https://www.alliedelec.com/m/d/4c8a9ef82804fc3c241a13c1e298fd73.pdf?src-supplier=Allied+Electronics; Supplier Part Number 1: SW1020DKR-ND
U1 = LAN9255/ZMX019: IC ETHERCAT SLAVE CONTROLLER; Manufacturer: Microchip; Manufacturer Part Number: LAN9255-I/ZMX019; Supplier 1: Digi-Key; Stock 1: 70; Pricing 1: 1=17.76000, 25=16.18480 (USD); Supplier Part Number 1: 150-LAN9255-I/ZMX019-ND
X1 = C3E-25.000-8-1015-X-M: CRYSTAL 25.0000MHZ 8PF SMD; Manufacturer: Aker Technology USA; Value: Custom; Manufacturer Part No: C3E-25.000-8-1015-X-M; Package: Custom